# Altium project EFI_Main_Board-V1.10.PrjPcb (part 3 of 3)
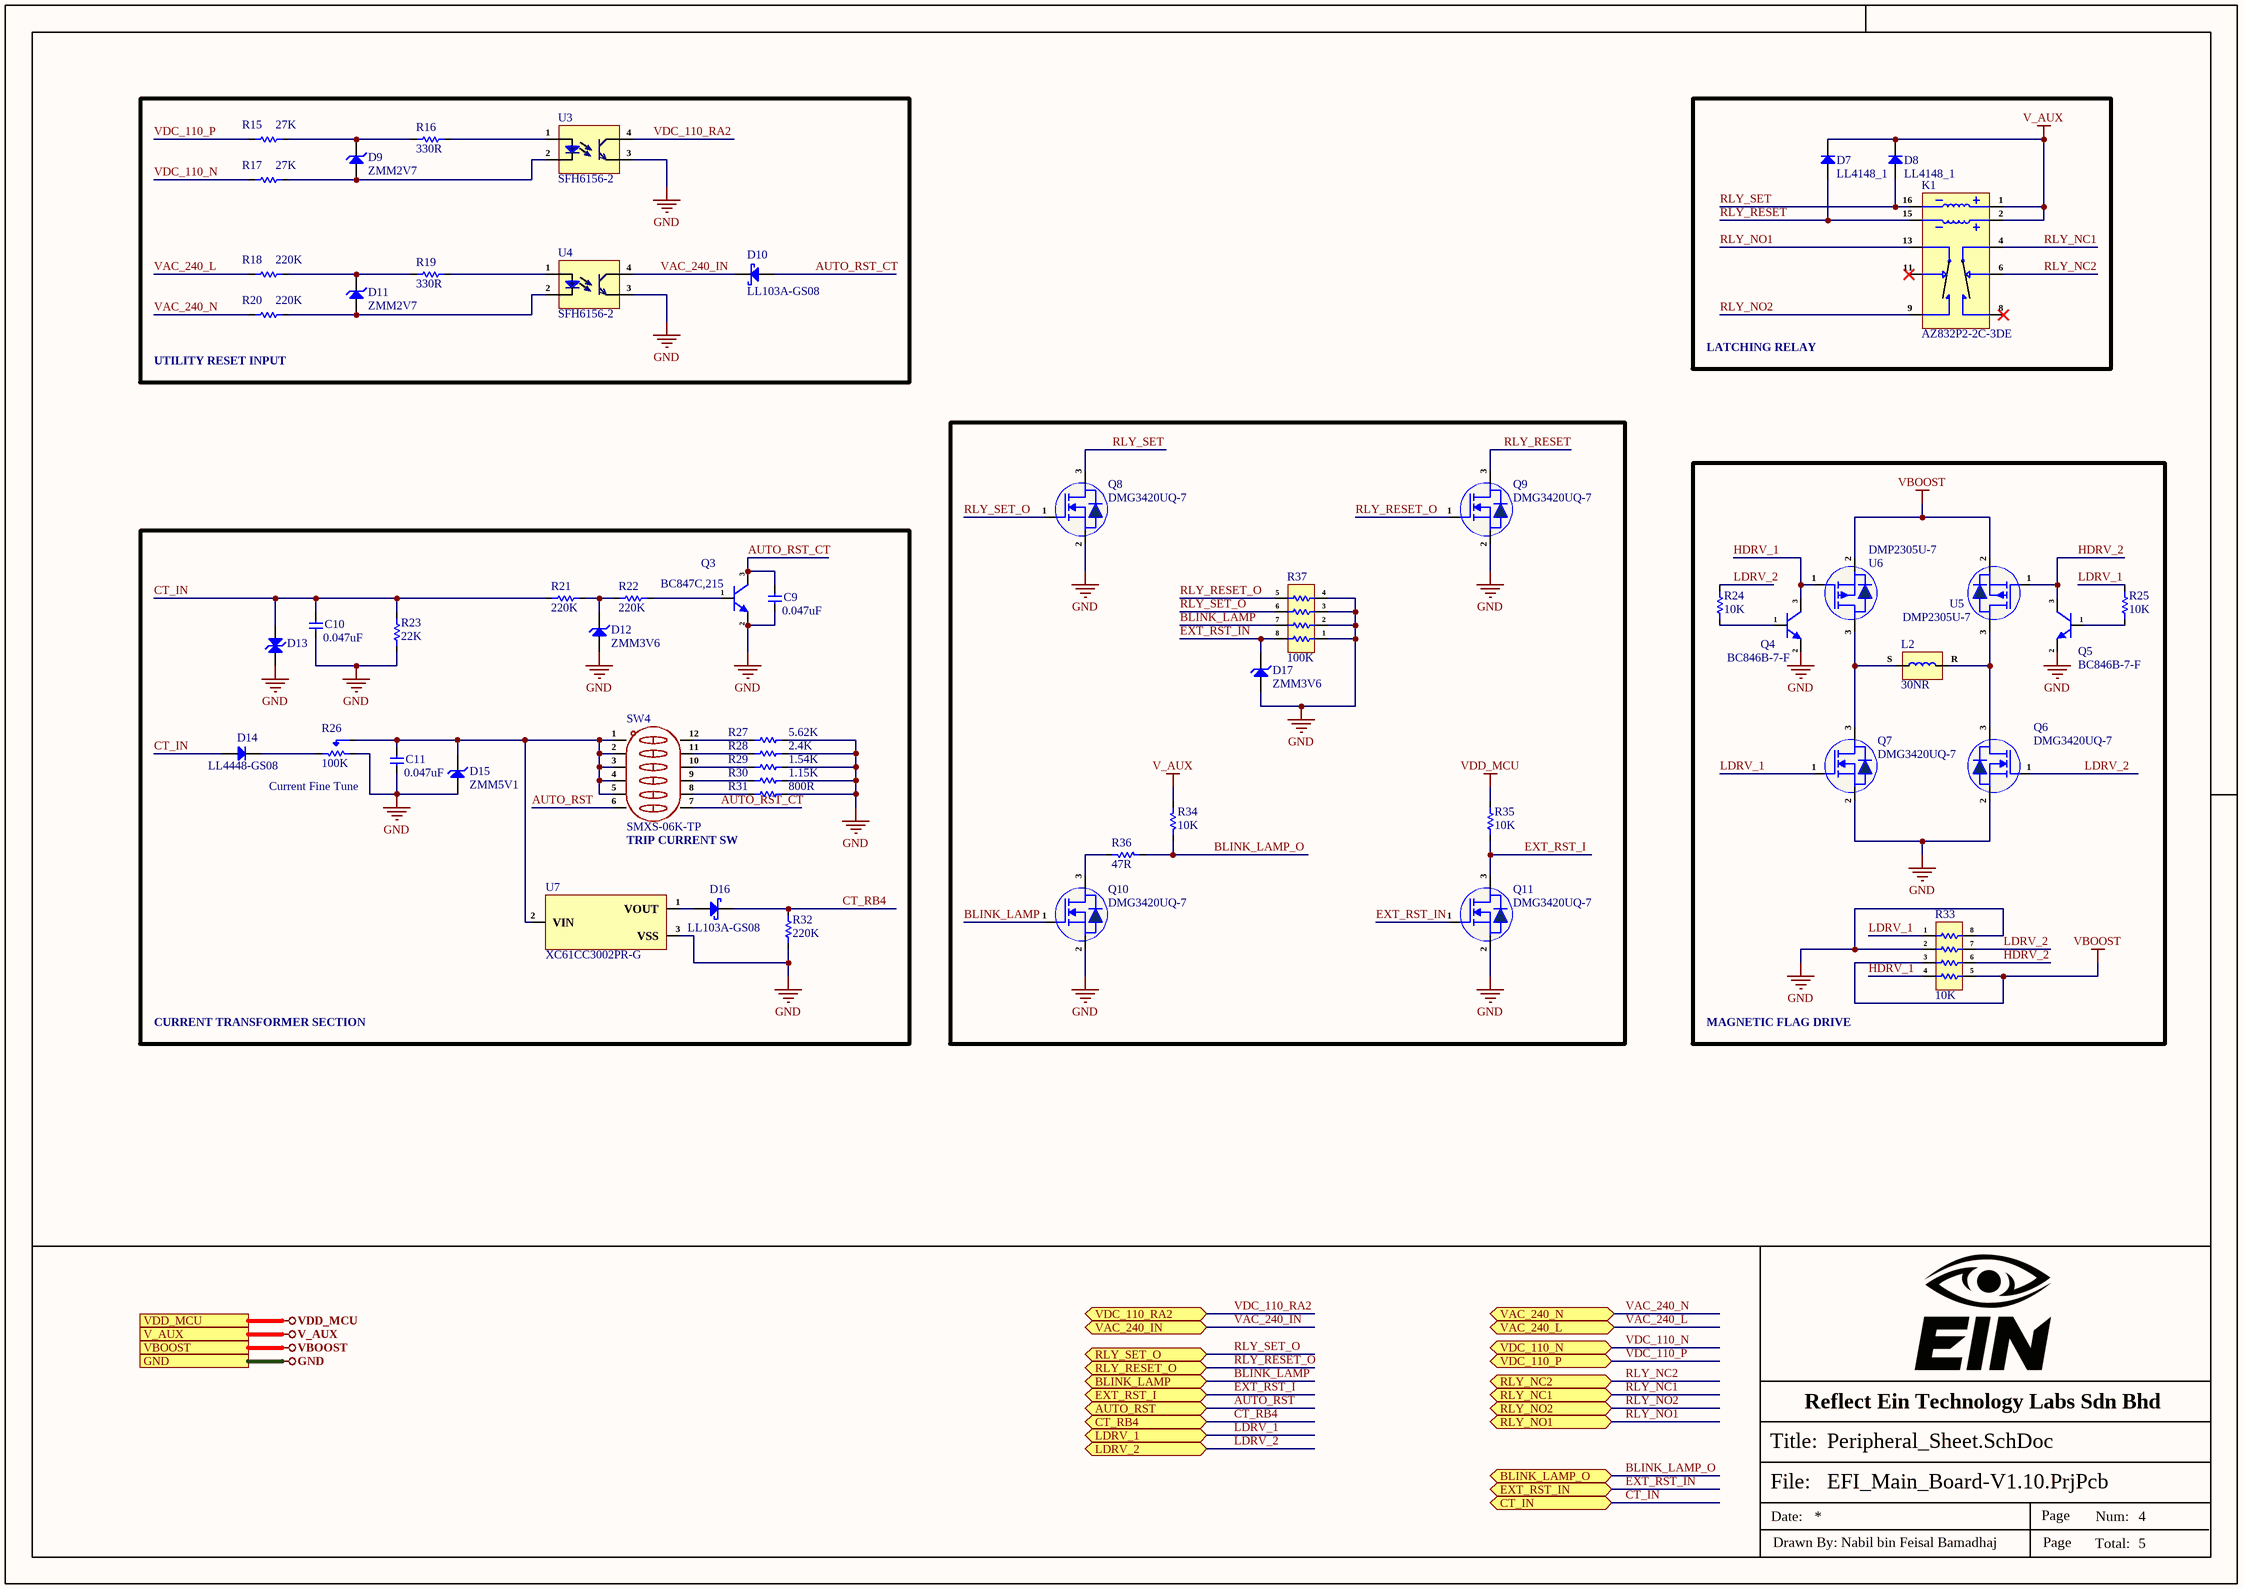
[diagram p5: Peripheral_Sheet.SchDoc]

## Nets that join several sheets
GND: Controller_Sheet (16 pins), Power_Sheet (10 pins), Connector_Sheet (J5.7), Peripheral_Sheet (33 pins)
V_AUX: Power_Sheet (C2.1 D3.1 L1.1), Connector_Sheet (J5.3 J5.4), Peripheral_Sheet (5 pins)
VBOOST: Power_Sheet (C3.1 C4.1 D4.1 R2.2), Peripheral_Sheet (R33.3 R33.5 U5.2 U6.2)
VDD_MCU: Controller_Sheet (7 pins), Power_Sheet (C1.1 D2.1), Peripheral_Sheet (R35.2)
AUTO_RST: Controller_Sheet (R11.2 U2.1), Peripheral_Sheet (SW4.6)
BATT_LOAD: Controller_Sheet (U2.24), Power_Sheet (Q2.1 R5.2)
BATT_LOW_SNS: Controller_Sheet (U2.15), Power_Sheet (D1.1)
BLINK_LAMP: Controller_Sheet (U2.19), Peripheral_Sheet (Q10.1 R37.7)
BLINK_LAMP_O: Connector_Sheet (J5.2), Peripheral_Sheet (R34.1 R36.1)
BOOST_FB1: Controller_Sheet (U2.26), Power_Sheet (R2.1 R3.2)
BOOST_FB2: Controller_Sheet (U2.27), Power_Sheet (R3.1)
BOOST_PWR: Controller_Sheet (U2.25), Power_Sheet (Q1.1 R4.2)
CT_IN: Connector_Sheet (J5.6), Peripheral_Sheet (5 pins)
CT_RB4: Controller_Sheet (U2.14), Peripheral_Sheet (D16.1 R32.1)
EXT_RST_I: Controller_Sheet (U2.11), Peripheral_Sheet (Q11.3 R35.1)
EXT_RST_IN: Connector_Sheet (R38.1), Peripheral_Sheet (D17.1 Q11.1 R37.8)
LDRV_1: Controller_Sheet (U2.9), Peripheral_Sheet (Q7.1 R25.2 R33.1)
LDRV_2: Controller_Sheet (U2.10), Peripheral_Sheet (Q6.1 R24.2 R33.7)
RLY_NC1: Connector_Sheet (J4.6), Peripheral_Sheet (K1.4)
RLY_NC2: Connector_Sheet (J4.5), Peripheral_Sheet (K1.6)
RLY_NO1: Connector_Sheet (J5.1), Peripheral_Sheet (K1.13)
RLY_NO2: Connector_Sheet (J4.7), Peripheral_Sheet (K1.9)
RLY_RESET_O: Controller_Sheet (U2.2), Peripheral_Sheet (Q9.1 R37.5)
RLY_SET_O: Controller_Sheet (U2.3), Peripheral_Sheet (Q8.1 R37.6)
VAC_240_IN: Controller_Sheet (D5.1), Peripheral_Sheet (D10.1 U4.4)
VAC_240_L: Connector_Sheet (J4.2), Peripheral_Sheet (R18.2)
VAC_240_N: Connector_Sheet (J4.1), Peripheral_Sheet (R20.2)
VDC_110_N: Connector_Sheet (J4.3), Peripheral_Sheet (R17.1)
VDC_110_P: Connector_Sheet (J4.4), Peripheral_Sheet (R15.1)
VDC_110_RA2: Controller_Sheet (R6.2 U2.21), Peripheral_Sheet (U3.4)